# Altium schematic sheet LEDs.SchDoc
size B; SheetNumber: 1; SheetTotal: 3
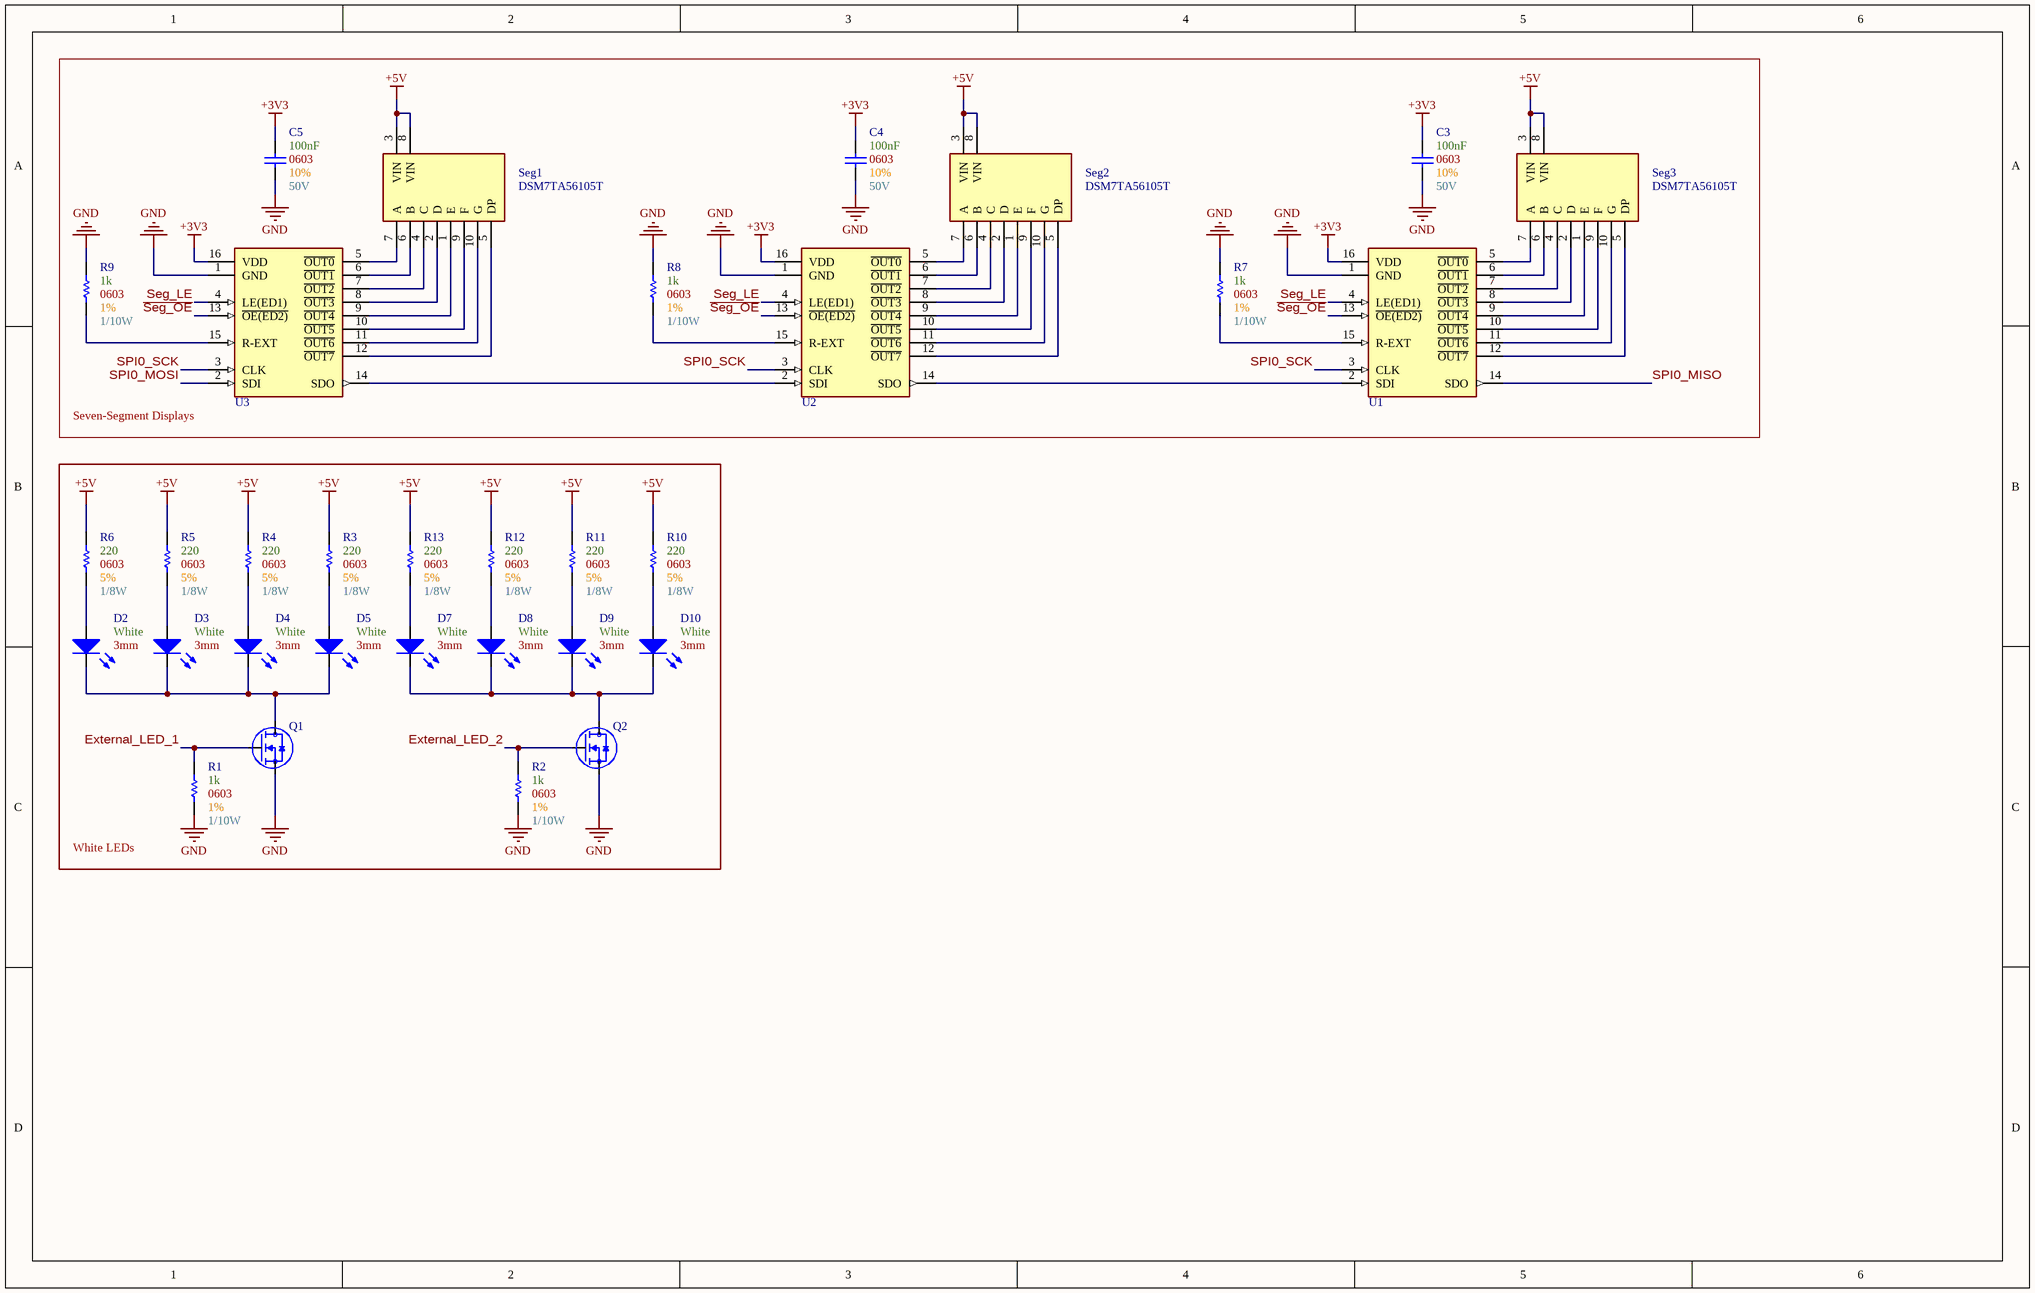
[diagram p0: LEDs.SchDoc]

## Parts
C3  Max Voltage: 50V  Size Package: 0603  Tolerance: 10%  Capacitance: 100nF  [[Cap] SMD 0603]  (hidden comment: [Cap] 0603 0.1uF 10% 50V)
C4  Max Voltage: 50V  Size Package: 0603  Tolerance: 10%  Capacitance: 100nF  [[Cap] SMD 0603]  (hidden comment: [Cap] 0603 0.1uF 10% 50V)
C5  Max Voltage: 50V  Size Package: 0603  Tolerance: 10%  Capacitance: 100nF  [[Cap] SMD 0603]  (hidden comment: [Cap] 0603 0.1uF 10% 50V)
D2  Color: White  Lens Diameter: 3mm  [[LED] Thru-Hole 3mm White]  (hidden comment: [LED] Thru-Hole 3mm White)
D3  Color: White  Lens Diameter: 3mm  [[LED] Thru-Hole 3mm White]  (hidden comment: [LED] Thru-Hole 3mm White)
D4  Color: White  Lens Diameter: 3mm  [[LED] Thru-Hole 3mm White]  (hidden comment: [LED] Thru-Hole 3mm White)
D5  Color: White  Lens Diameter: 3mm  [[LED] Thru-Hole 3mm White]  (hidden comment: [LED] Thru-Hole 3mm White)
D7  Color: White  Lens Diameter: 3mm  [[LED] Thru-Hole 3mm White]  (hidden comment: [LED] Thru-Hole 3mm White)
D8  Color: White  Lens Diameter: 3mm  [[LED] Thru-Hole 3mm White]  (hidden comment: [LED] Thru-Hole 3mm White)
D9  Color: White  Lens Diameter: 3mm  [[LED] Thru-Hole 3mm White]  (hidden comment: [LED] Thru-Hole 3mm White)
D10  Color: White  Lens Diameter: 3mm  [[LED] Thru-Hole 3mm White]  (hidden comment: [LED] Thru-Hole 3mm White)
Q1  [NMOS] SMD 20V 1.4A 160mOhm  [SOT323]  (value not drawn)
Q2  [NMOS] SMD 20V 1.4A 160mOhm  [SOT323]  (value not drawn)
R1  Wattage: 1/10W  Tolerance: 1%  Resistance: 1k  Size Package: 0603  [[Res] SMD 0603]  (hidden comment: [1k] SMD 0603 1% 1/10W)
R2  Wattage: 1/10W  Tolerance: 1%  Resistance: 1k  Size Package: 0603  [[Res] SMD 0603]  (hidden comment: [1k] SMD 0603 1% 1/10W)
R3  Wattage: 1/8W  Tolerance: 5%  Resistance: 220  Size Package: 0603  [[Res] SMD 0603]  (hidden comment: [220] SMD 0603 5% 1/10W)
R4  Wattage: 1/8W  Tolerance: 5%  Resistance: 220  Size Package: 0603  [[Res] SMD 0603]  (hidden comment: [220] SMD 0603 5% 1/10W)
R5  Wattage: 1/8W  Tolerance: 5%  Resistance: 220  Size Package: 0603  [[Res] SMD 0603]  (hidden comment: [220] SMD 0603 5% 1/10W)
R6  Wattage: 1/8W  Tolerance: 5%  Resistance: 220  Size Package: 0603  [[Res] SMD 0603]  (hidden comment: [220] SMD 0603 5% 1/10W)
R7  Wattage: 1/10W  Tolerance: 1%  Resistance: 1k  Size Package: 0603  [[Res] SMD 0603]  (hidden comment: [1k] SMD 0603 1% 1/10W)
R8  Wattage: 1/10W  Tolerance: 1%  Resistance: 1k  Size Package: 0603  [[Res] SMD 0603]  (hidden comment: [1k] SMD 0603 1% 1/10W)
R9  Wattage: 1/10W  Tolerance: 1%  Resistance: 1k  Size Package: 0603  [[Res] SMD 0603]  (hidden comment: [1k] SMD 0603 1% 1/10W)
R10  Wattage: 1/8W  Tolerance: 5%  Resistance: 220  Size Package: 0603  [[Res] SMD 0603]  (hidden comment: [220] SMD 0603 5% 1/10W)
R11  Wattage: 1/8W  Tolerance: 5%  Resistance: 220  Size Package: 0603  [[Res] SMD 0603]  (hidden comment: [220] SMD 0603 5% 1/10W)
R12  Wattage: 1/8W  Tolerance: 5%  Resistance: 220  Size Package: 0603  [[Res] SMD 0603]  (hidden comment: [220] SMD 0603 5% 1/10W)
R13  Wattage: 1/8W  Tolerance: 5%  Resistance: 220  Size Package: 0603  [[Res] SMD 0603]  (hidden comment: [220] SMD 0603 5% 1/10W)
Seg1  DSM7TA56105T  [[Segment Display] Single 7-Seg Common Anode SMD]
Seg2  DSM7TA56105T  [[Segment Display] Single 7-Seg Common Anode SMD]
Seg3  DSM7TA56105T  [[Segment Display] Single 7-Seg Common Anode SMD]
U1  [Shift Register] Common Anode LED Dimmable  [16-TSSOP]  (value not drawn)
U2  [Shift Register] Common Anode LED Dimmable  [16-TSSOP]  (value not drawn)
U3  [Shift Register] Common Anode LED Dimmable  [16-TSSOP]  (value not drawn)

## Blocks framed on the sheet
Seven-Segment Displays: C3-C5 R7-R9 Seg1-Seg3 U1-U3
White LEDs: D2-D5 D7-D10 Q1 Q2 R1-R6 R10-R13

## Nets
+3V3: C3.2 C4.2 C5.2 U1.16(VDD) U2.16(VDD) U3.16(VDD)
+5V: R3.2 R4.2 R5.2 R6.2 R10.2 R11.2 R12.2 R13.2 Seg1.3(VIN) Seg1.8(VIN) Seg2.3(VIN) Seg2.8(VIN) Seg3.3(VIN) Seg3.8(VIN)
GND: C3.1 C4.1 C5.1 Q1.2(Source) Q2.2(Source) R1.1 R2.1 R7.2 R8.2 R9.2 U1.1(GND) U2.1(GND) U3.1(GND)
~{Seg_OE}: U1.13(~{OE(ED2)}) U2.13(~{OE(ED2)}) U3.13(~{OE(ED2)})
External_LED_1: Q1.1(Gate) R1.2
External_LED_2: Q2.1(Gate) R2.2
Seg_LE: U1.4(LE(ED1)) U2.4(LE(ED1)) U3.4(LE(ED1))
SPI0_MISO: U1.14(SDO)
SPI0_MOSI: U3.2(SDI)
SPI0_SCK: U1.3(CLK) U2.3(CLK) U3.3(CLK)
NetD2_1: D2.1(Anode) R6.1
NetD2_2: D2.2(Cathode) D3.2(Cathode) D4.2(Cathode) D5.2(Cathode) Q1.3(Drain)
NetD3_1: D3.1(Anode) R5.1
NetD4_1: D4.1(Anode) R4.1
NetD5_1: D5.1(Anode) R3.1
NetD7_1: D7.1(Anode) R13.1
NetD7_2: D7.2(Cathode) D8.2(Cathode) D9.2(Cathode) D10.2(Cathode) Q2.3(Drain)
NetD8_1: D8.1(Anode) R12.1
NetD9_1: D9.1(Anode) R11.1
NetD10_1: D10.1(Anode) R10.1
NetR7_1: R7.1 U1.15(R-EXT)
NetR8_1: R8.1 U2.15(R-EXT)
NetR9_1: R9.1 U3.15(R-EXT)
NetSeg1_1: Seg1.1(E) U3.9(~{OUT4})
NetSeg1_2: Seg1.2(D) U3.8(~{OUT3})
NetSeg1_4: Seg1.4(C) U3.7(~{OUT2})
NetSeg1_5: Seg1.5(DP) U3.12(~{OUT7})
NetSeg1_6: Seg1.6(B) U3.6(~{OUT1})
NetSeg1_7: Seg1.7(A) U3.5(~{OUT0})
NetSeg1_9: Seg1.9(F) U3.10(~{OUT5})
NetSeg1_10: Seg1.10(G) U3.11(~{OUT6})
NetSeg2_1: Seg2.1(E) U2.9(~{OUT4})
NetSeg2_2: Seg2.2(D) U2.8(~{OUT3})
NetSeg2_4: Seg2.4(C) U2.7(~{OUT2})
NetSeg2_5: Seg2.5(DP) U2.12(~{OUT7})
NetSeg2_6: Seg2.6(B) U2.6(~{OUT1})
NetSeg2_7: Seg2.7(A) U2.5(~{OUT0})
NetSeg2_9: Seg2.9(F) U2.10(~{OUT5})
NetSeg2_10: Seg2.10(G) U2.11(~{OUT6})
NetSeg3_1: Seg3.1(E) U1.9(~{OUT4})
NetSeg3_2: Seg3.2(D) U1.8(~{OUT3})
NetSeg3_4: Seg3.4(C) U1.7(~{OUT2})
NetSeg3_5: Seg3.5(DP) U1.12(~{OUT7})
NetSeg3_6: Seg3.6(B) U1.6(~{OUT1})
NetSeg3_7: Seg3.7(A) U1.5(~{OUT0})
NetSeg3_9: Seg3.9(F) U1.10(~{OUT5})
NetSeg3_10: Seg3.10(G) U1.11(~{OUT6})
NetU1_2: U1.2(SDI) U2.14(SDO)
NetU2_2: U2.2(SDI) U3.14(SDO)

## Library data of the parts
C3-C5 = [Cap] 0603 0.1uF 10% 50V: CL10B104KB8NNNC; Supplier 1: DigiKey; Supplier Part Number 1: 1276-1000-6-ND
D2-D5 D7-D10 = [LED] Thru-Hole 3mm White: QBL7IW60D-WW; Supplier 1: DigiKey; Supplier Part Number 1: 1516-QBL7IW60D-WW-ND
Q1 Q2 = [NMOS] SMD 20V 1.4A 160mOhm: BSS816NWH6327XTSA1; Supplier 1: DigiKey; Supplier Part Number 1: BSS816NWH6327XTSA1CT-ND
R1 R2 R7-R9 = [1k] SMD 0603 1% 1/10W: RMCF0603FT1K00; Supplier 1: DigiKey; Supplier Part Number 1: RMCF0603FT1K00DKR-ND
R3-R6 R10-R13 = [220] SMD 0603 5% 1/10W: RK73B1JTTD221J; Supplier 1: DigiKey; Supplier Part Number 1: 2019-RK73B1JTTD221JDKR-ND
Seg1-Seg3 = [Segment Display] Single 7-Seg Common Anode SMD: Supplier 1: DigiKey; Supplier Part Number 1: DSM7TA56105TCT-ND
U1-U3 = [Shift Register] Common Anode LED Dimmable: TLC5916IPW; Supplier 1: DigiKey; Supplier Part Number 1: 296-34370-5-ND